# EasyEDA Pro project ProPrj_CH374_ESP32.epro

# Schematic CH374
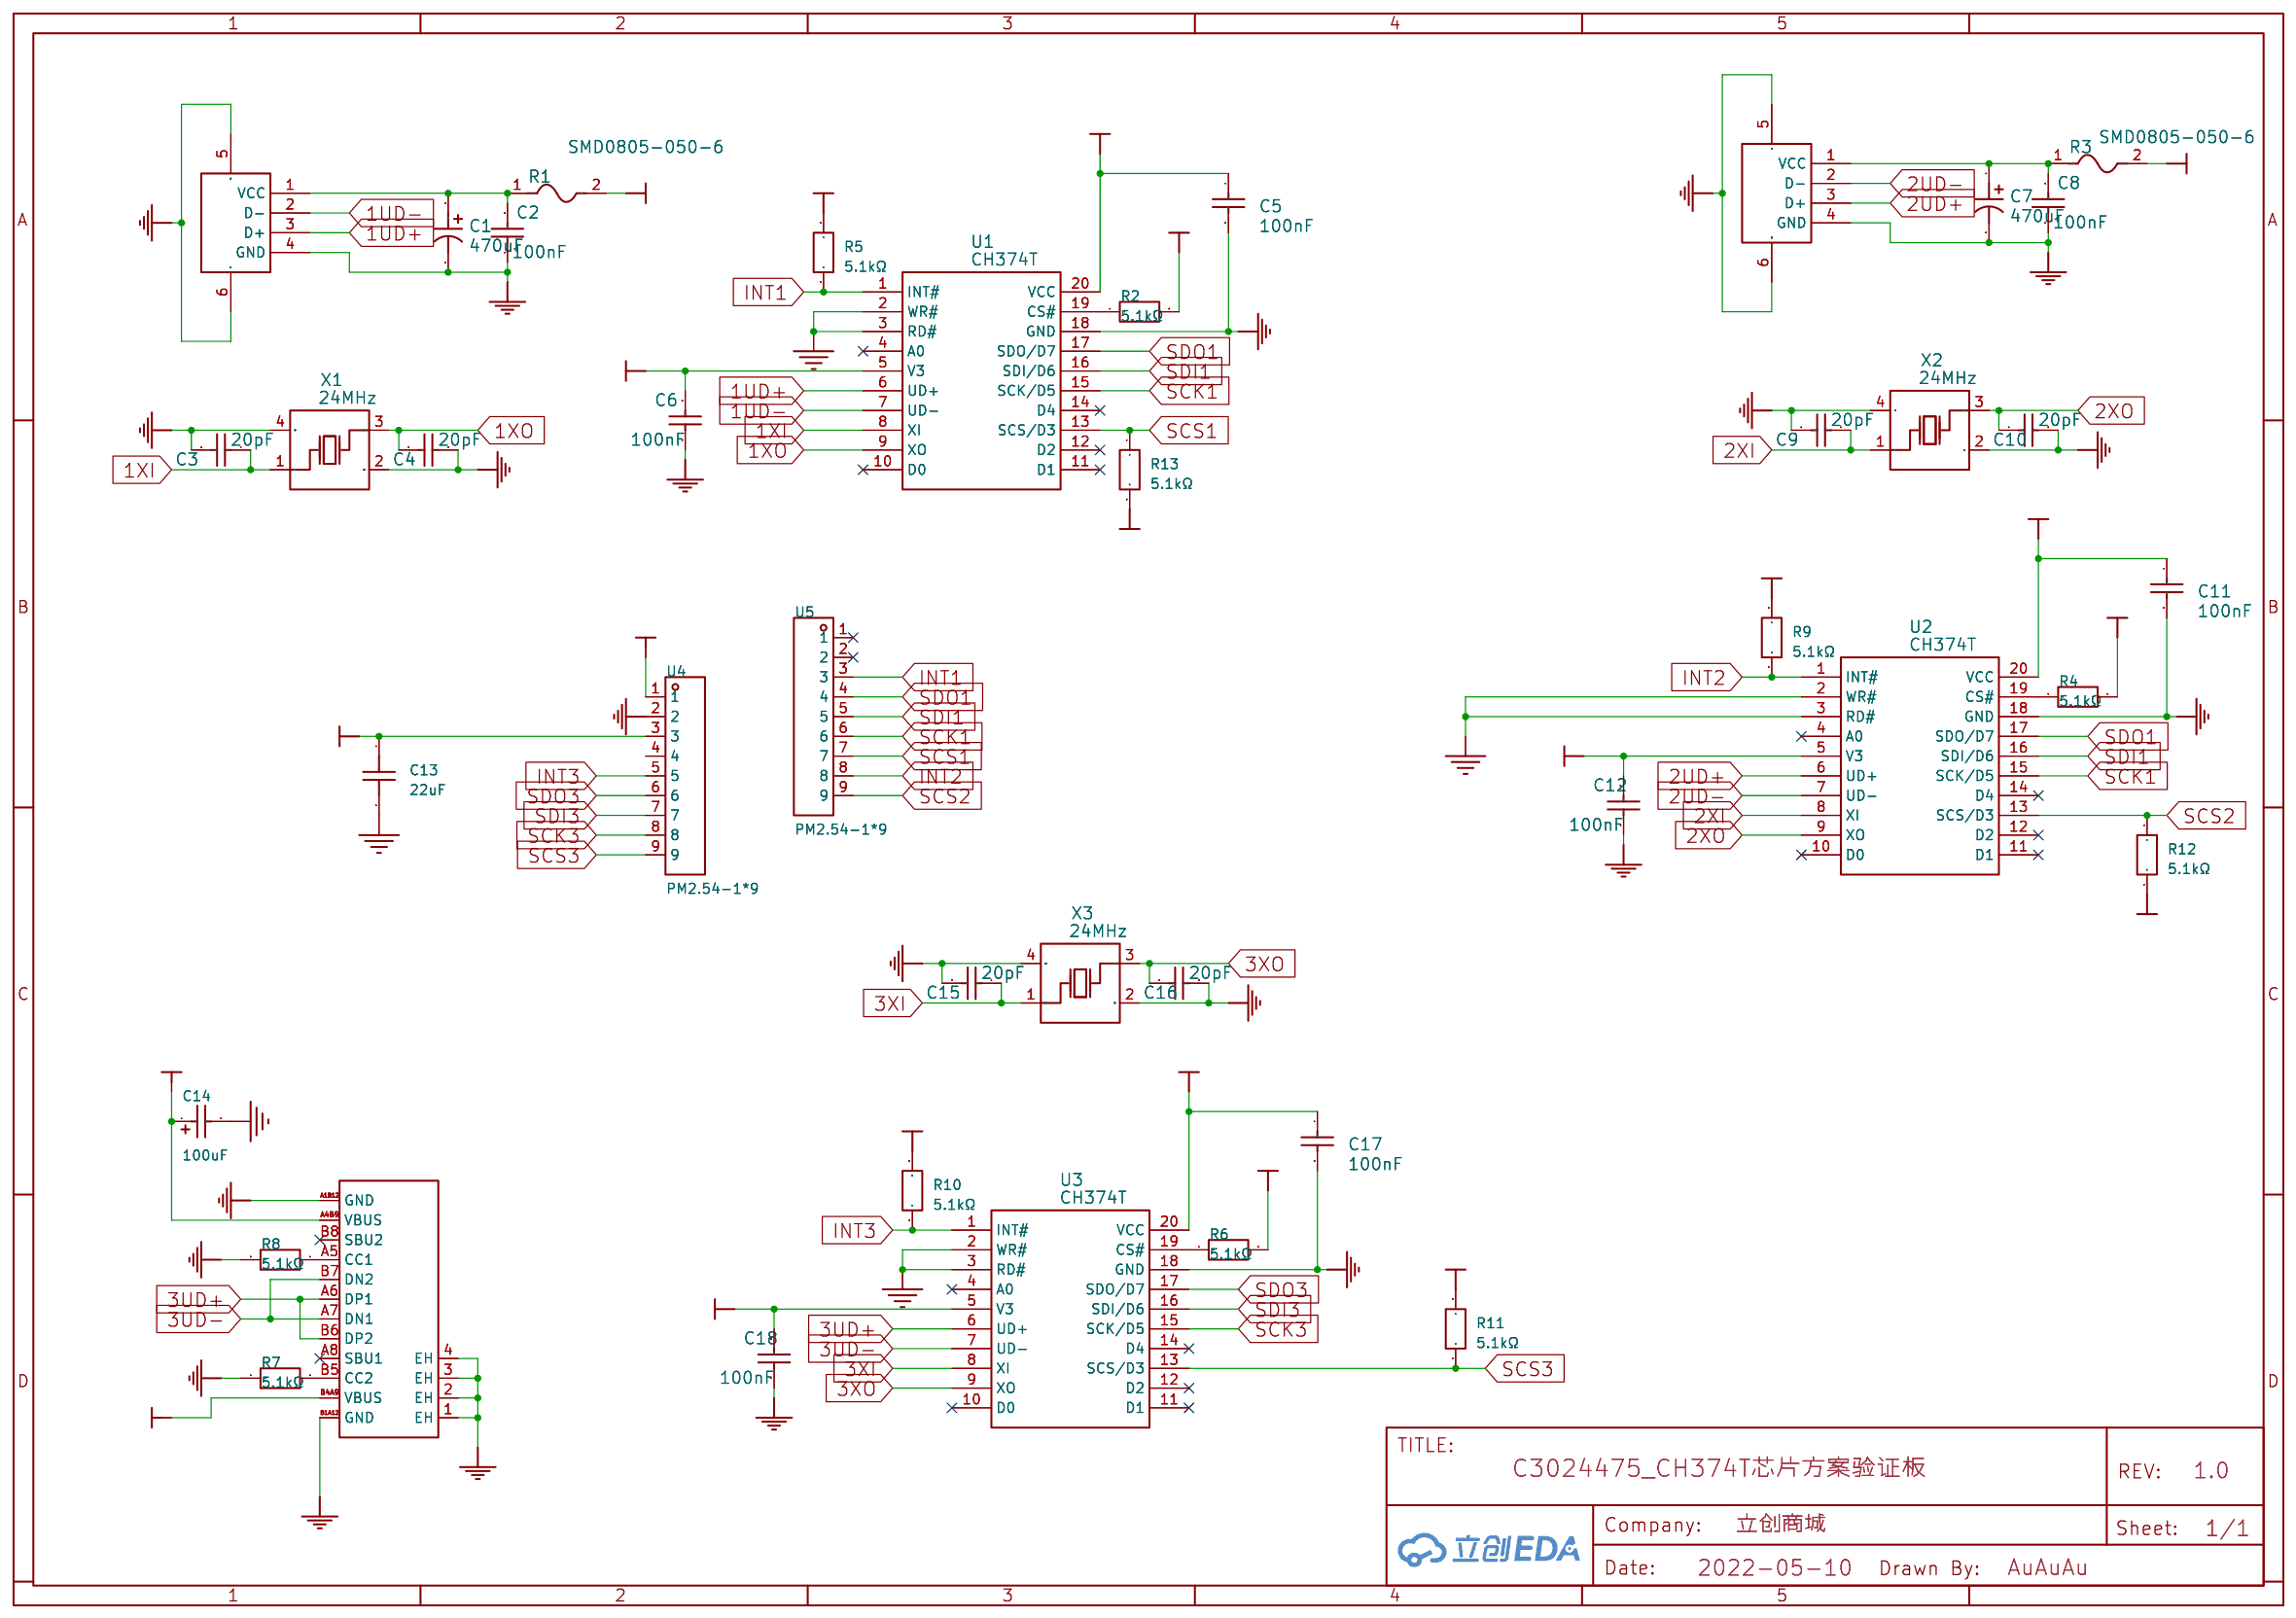
[diagram p0: schematic sheet]

## Parts
C1  470uF  [CAP-SMD_BD6.3-L6.6-W6.6-FD]
C2  100nF  [C0603]
C3  20pF  [C0603]
C4  20pF  [C0603]
C5  100nF  [C0603]
C6  100nF  [C0603]
C7  470uF  [CAP-SMD_BD6.3-L6.6-W6.6-FD]
C8  100nF  [C0603]
C9  20pF  [C0603]
C10  20pF  [C0603]
C11  100nF  [C0603]
C12  100nF  [C0603]
C13  22uF  [C0805]
C14  100uF  [CASE-B_3528]
C15  20pF  [C0603]
C16  20pF  [C0603]
C17  100nF  [C0603]
C18  100nF  [C0603]
R1  SMD0805-050-6  [F0805]
R2  5.1kΩ  [R0603]
R3  SMD0805-050-6  [F0805]
R4  5.1kΩ  [R0603]
R5  5.1kΩ  [R0603]
R6  5.1kΩ  [R0603]
R7  5.1kΩ  [R0603]
R8  5.1kΩ  [R0603]
R9  5.1kΩ  [R0603]
R10  5.1kΩ  [R0603]
R11  5.1kΩ  [R0603]
R12  5.1kΩ  [R0603]
R13  5.1kΩ  [R0603]
U1  CH374T  [SSOP-20_L7.5-W5.2-P0.65-LS8.0-BL]
U2  CH374T  [SSOP-20_L7.5-W5.2-P0.65-LS8.0-BL]
U3  CH374T  [SSOP-20_L7.5-W5.2-P0.65-LS8.0-BL]
U4  PM2.54-1*9  [HDR-TH_9P-P2.54-V-F-1]
U5  PM2.54-1*9  [HDR-TH_9P-P2.54-V-F-1]
USB1  U-USBAR04P-F002  [USB-A-TH_USB-302-T]
USB2  U-USBAR04P-F002  [USB-A-TH_USB-302-T]
USB3  TYPE-C-31-M-12  [USB-C_SMD-TYPE-C-31-M-12_1]
X1  24MHz  [CRYSTAL-SMD_4P-L3.2-W2.5-BL]
X2  24MHz  [CRYSTAL-SMD_4P-L3.2-W2.5-BL]
X3  24MHz  [CRYSTAL-SMD_4P-L3.2-W2.5-BL]

## Library data of the parts
C1 C7 = RVT1A471M0607_C335982: 容值:470uF;精度:±20%;额定电压:10V;纹波电流:200mA@120Hz;等效串联电阻(ESR):-;; LCSC Part Name: 470uF ±20% 10V; Supplier Part: C335982; Manufacturer: ROQANG(容强); Manufacturer Part: RVT1A471M0607; Supplier Footprint: SMD,D6.3xL7.7mm; JLCPCB Part Class: Extended Part; Supplier: LCSC; Tolerance: ±20%; Voltage Rating: 10V; Ripple Current: 200mA@120Hz; Diameter: 6.3mm; Height - Seated (Max): 7.7mm; Lifetime: 2000hrs@105℃; Operating Temperature: -40℃~+105℃; Type: 聚合物; PCB Layer: TopLayer
C2 C5 C6 = 0603B104K500NT: 容值:100nF;精度:±10%;额定电压:50V;温度系数:X7R;; LCSC Part Name: 100nF ±10% 50V; Supplier Part: C30926; Manufacturer: FH(风华); Supplier Footprint: 0603; JLCPCB Part Class: Extended Part; Datasheet: https://item.szlcsc.com/datasheet/0603B104K500NT/31683.html; Supplier: LCSC; Tolerance: ±10%; Voltage Rating: 50V; Temperature Coefficient: X7R; PCB Layer: TopLayer
C3 C4 = CC0603JRNPO9BN200: 容值:20pF;精度:±5%;额定电压:50V;材质(温度系数):NP0;; LCSC Part Name: 20pF ±5% 50V; Supplier Part: C105621; Manufacturer: YAGEO(国巨); Supplier Footprint: 0603; JLCPCB Part Class: Extended Part; Datasheet: https://atta.szlcsc.com/upload/public/pdf/source/20170505/1493957838062.pdf; Supplier: LCSC; Tolerance: ±5%; Voltage Rated: 50V; Temperature Coefficient: NP0; PCB Layer: TopLayer
C8 C11 C12 C17 C18 = 0603B104K500NT: 容值:100nF;精度:±10%;额定电压:50V;温度系数:X7R;; LCSC Part Name: 100nF ±10% 50V; Supplier Part: C30926; Manufacturer: FH(风华); Supplier Footprint: 0603; JLCPCB Part Class: Extended Part; Datasheet: https://item.szlcsc.com/datasheet/0603B104K500NT/31683.html; Supplier: LCSC; Tolerance: ±10%; Voltage Rating: 50V; Temperature Coefficient: X7R; Origin 3D Model Title: C0603_L1.6-W0.8-H0.8; PCB Layer: TopLayer
C9 C10 C15 C16 = CC0603JRNPO9BN200: 容值:20pF;精度:±5%;额定电压:50V;材质(温度系数):NP0;; LCSC Part Name: 20pF ±5% 50V; Supplier Part: C105621; Manufacturer: YAGEO(国巨); Supplier Footprint: 0603; JLCPCB Part Class: Extended Part; Datasheet: https://atta.szlcsc.com/upload/public/pdf/source/20170505/1493957838062.pdf; Supplier: LCSC; Tolerance: ±5%; Voltage Rated: 50V; Temperature Coefficient: NP0; Origin 3D Model Title: C0603_L1.6-W0.8-H0.8; PCB Layer: TopLayer
C13 = FCC0805X226M250FT: 容值:22uF;精度:±20%;额定电压:25V;温度系数:X5R;; LCSC Part Name: 22uF ±20% 25V; Supplier Part: C7419435; Manufacturer: FOJAN(富捷); Supplier Footprint: 0805; JLCPCB Part Class: Extended Part; Datasheet: https://item.szlcsc.com/datasheet/FCC0805X226M250FT/8393417.html; Supplier: LCSC; Tolerance: ±20%; Voltage Rating: 25V; Temperature Coefficient: X5R
C14 = TAJB107K006RNJ: 容值:100uF;精度:±10%;额定电压:6.3V;等效串联电阻(ESR):1.7Ω@100kHz;; LCSC Part Name: 100uF ±10% 6.3V; Supplier Part: C16133; Manufacturer: Kyocera AVX; Supplier Footprint: CASE-B-3528-21(mm); JLCPCB Part Class: Basic Part; Supplier: LCSC; Tolerance: ±10%; Voltage Rating: 6.3V; Equivalent Series Resistance(ESR): 1.7Ω@100kHz; Operating Temperature: -55℃~+125℃
R1 R3 = SMD0805-050-6: 耐压(Vmax):6V;最大电流(Imax):40A;保持电流(Ihold):500mA;跳闸电流(Itrip):1A;; LCSC Part Name: 6V 500mA; Supplier Part: C46640983; Manufacturer: R+O(宏嘉诚); Supplier Footprint: 0805; JLCPCB Part Class: Extended Part; Datasheet: https://item.szlcsc.com/datasheet/SMD0805-050-6/48798689.html; Supplier: LCSC; Voltage - Max: 6V; Current - Max: 40A; Hold Current: 500mA; Trip Current: 1A; Power Dissipation: 500mW; Resistance - Initial (Ri) (Min): 100mΩ; Resistance - Post Trip (R1) (Max): 850mΩ; Time to Trip(Max): 100ms; Operating Temperature: -40℃~+85℃; Length: 2.2mm; Width: 1.5mm; Height: 0.8mm
R2 R4-R13 = FRC0603F5101TS: 电阻类型:厚膜电阻;阻值:5.1kΩ;精度:±1%;功率:100mW;工作电压:75V;温度系数:±100ppm/℃;; LCSC Part Name: 5.1kΩ ±1% 100mW 厚膜电阻; Supplier Part: C2907044; Manufacturer: FOJAN(富捷); Supplier Footprint: 0603; JLCPCB Part Class: Extended Part; Supplier: LCSC; Type: 厚膜电阻; Tolerance: ±1%; Power(Watts): 100mW; Voltage-Supply(Max): 75V; Temperature Coefficient: ±100ppm/℃; Operating Temperature: -55℃~+155℃
U1 = CH374T: 应用功能:收发器;接口协议:USB 2.0;通道数:3;数据速率:12Mbps;; LCSC Part Name: USB总线接口芯片CH374; Supplier Part: C81627; Manufacturer: WCH(南京沁恒); Supplier Footprint: SSOP-20-208mil; JLCPCB Part Class: Extended Part; Datasheet: https://atta.szlcsc.com/upload/public/pdf/source/20240313/68BEEFB9FCA26BF3F560373D7752B1DD.pdf; Supplier: LCSC; Applications Function: 收发器; Protocol: USB 2.0; Number of Channels: 3; Supply Voltage: 5V；3.3V; Data Rate: 12Mbps; Operating Temperature: -40℃~+85℃; PCB Layer: TopLayer
U2 U3 = CH374T: 应用功能:收发器;接口协议:USB 2.0;通道数:3;数据速率:12Mbps;; LCSC Part Name: USB总线接口芯片CH374; Supplier Part: C81627; Manufacturer: WCH(南京沁恒); Supplier Footprint: SSOP-20-208mil; JLCPCB Part Class: Extended Part; Datasheet: https://atta.szlcsc.com/upload/public/pdf/source/20240313/68BEEFB9FCA26BF3F560373D7752B1DD.pdf; Supplier: LCSC; Applications Function: 收发器; Protocol: USB 2.0; Number of Channels: 3; Supply Voltage: 5V；3.3V; Data Rate: 12Mbps; Operating Temperature: -40℃~+85℃; Origin 3D Model Title: SSOP-20_L7.3-W5.3-H2.0-LS8.0-P0.65; PCB Layer: TopLayer
U4 U5 = PM2.54-1*9: 插孔结构:1x9P;间距:2.54mm;行距:2.54mm;圆孔/方孔:方孔;安装方式:直插;排数:单排;总孔位数:9P;额定电流:2.5A;插孔方向:顶部;塑高:8.5mm;工作温度:-40℃~+105℃;; LCSC Part Name: 间距:2.54mm 1x9P 直插; Supplier Part: C5224028; Manufacturer: ZHOURI(洲日); Supplier Footprint: 插件,P=2.54mm; JLCPCB Part Class: Extended Part; Datasheet: https://item.szlcsc.com/datasheet/PM2.54-1*9/5925207.html; Supplier: LCSC; Holes Structure: 1x9P; Pitch: 2.54mm; Row Spacing: 2.54mm; Circular Hole / Square Hole: 方孔; Mounting Type: 直插; Number of Rows: 单排; Number of Positions: 9P; Current Rating: 2.5A; Holes Direction: 顶部; Insulation Height: 8.5mm; Operating Temperature: -40℃~+105℃
USB1 USB2 = U-USBAR04P-F002: 连接器类型:Type-A;协议标准:USB 2.0;公母:母;安装方式:弯插;触点数量:4P;端口数量:1;额定电流 - 电源:1.5A;工作温度:0℃~+50℃;; LCSC Part Name: USB母座; Supplier Part: C386736; Manufacturer: Ckmtw(灿科盟); Supplier Footprint: 弯插; JLCPCB Part Class: Extended Part; Datasheet: https://item.szlcsc.com/datasheet/U-USBAR04P-F002/360843.html; Supplier: LCSC; Connector Type: Type-A; Protocol Standard: USB 2.0; Gender: 母; Mounting Type: 弯插; Number of Contacts: 4P; Number of Ports: 1; Current Rating-Power: 1.5A; Voltage Rating: 30V; Length: 14mm; Detection color: 白色; Operating Temperature: 0℃~+50℃; PCB Layer: TopLayer
USB3 = TYPE-C-31-M-12: 连接器类型:Type-C;协议标准:-;公母:母;安装方式:卧贴;触点数量:16P;端口数量:1;额定电流 - 电源:5A;工作温度:-30℃~+80℃;; LCSC Part Name: Type-C 母 卧贴; Supplier Part: C165948; Manufacturer: 韩国韩荣; Supplier Footprint: SMD; JLCPCB Part Class: Extended Part; Datasheet: https://item.szlcsc.com/datasheet/TYPE-C-31-M-12/177331.html; Supplier: LCSC; Connector Type: Type-C; Gender: 母; Mounting Type: 卧贴; Number of Contacts: 16P; Number of Ports: 1; Current Rating-Power: 5A; Voltage Rating: 20V; Connect-Disconnect Life: 1万次; Length: 7.35mm; Operating Temperature: -30℃~+80℃
X1 = X322524MSB4SI: 晶振类型:贴片晶振;频率:24MHz;常温频差:±10ppm;负载电容:20pF;频率稳定度:±20ppm;; LCSC Part Name: YSX321SL 24MHZ 4P 3225 20PF ±10PPM -40~85℃ (±20PPM); Supplier Part: C15643; Manufacturer: YXC(扬兴晶振); Supplier Footprint: SMD3225-4P; JLCPCB Part Class: Extended Part; Datasheet: https://item.szlcsc.com/datasheet/X322524MSB4SI/16324.html; Supplier: LCSC; Type: 贴片晶振; Normal temperature Frequency Tolerance: ±10ppm; Load Capacitance: 20pF; Frequency Stability: ±20ppm; Operating Temperature: -40℃~+85℃; PCB Layer: TopLayer
X2 X3 = X322524MSB4SI: 晶振类型:贴片晶振;频率:24MHz;常温频差:±10ppm;负载电容:20pF;频率稳定度:±20ppm;; LCSC Part Name: YSX321SL 24MHZ 4P 3225 20PF ±10PPM -40~85℃ (±20PPM); Supplier Part: C15643; Manufacturer: YXC(扬兴晶振); Supplier Footprint: SMD3225-4P; JLCPCB Part Class: Extended Part; Datasheet: https://item.szlcsc.com/datasheet/X322524MSB4SI/16324.html; Supplier: LCSC; Type: 贴片晶振; Normal temperature Frequency Tolerance: ±10ppm; Load Capacitance: 20pF; Frequency Stability: ±20ppm; Operating Temperature: -40℃~+85℃; Origin 3D Model Title: OSC-SMD_4P-L3.2-W2.5-H1.0; PCB Layer: TopLayer

## Nets
3V3: C5.1 C6.2 C11.1 C12.2 C13.1 C17.1 C18.2 R2.2 R4.2 R5.2 R6.2 R9.2 R10.2 R11.2 R12.2 R13.2 U1.5(V3) U1.20(VCC) U2.5(V3) U2.20(VCC) U3.5(V3) U3.20(VCC) U4.3
5V: C14.1 R1.2 R3.2 U4.1 USB3.A4B9(VBUS) USB3.B4A9(VBUS)
GND: C1.2 C2.1 C3.2 C4.2 C5.2 C6.1 C7.2 C8.1 C9.2 C10.2 C11.2 C12.1 C13.2 C14.2 C15.2 C16.2 C17.2 C18.1 R7.1 R8.2 U1.2(WR#) U1.3(RD#) U1.18(GND) U2.2(WR#) U2.3(RD#) U2.18(GND) U3.2(WR#) U3.3(RD#) U3.18(GND) U4.2 USB1.4(GND) USB1.5(SH1) USB1.6(SH2) USB2.4(GND) USB2.5(SH1) USB2.6(SH2) USB3.1(EH) USB3.2(EH) USB3.3(EH) USB3.4(EH) USB3.A1B12(GND) USB3.B1A12(GND) X1.2(GND) X1.4(GND) X2.2(GND) X2.4(GND) X3.2(GND) X3.4(GND)
1UD+: U1.6(UD+) USB1.3(D+)
1UD-: U1.7(UD-) USB1.2(D-)
1XI: C3.1 U1.8(XI) X1.1(OSC1)
1XO: C4.1 U1.9(XO) X1.3(OSC2)
2UD+: U2.6(UD+) USB2.3(D+)
2UD-: U2.7(UD-) USB2.2(D-)
2XI: C9.1 U2.8(XI) X2.1(OSC1)
2XO: C10.1 U2.9(XO) X2.3(OSC2)
3UD+: U3.6(UD+) USB3.A6(DP1) USB3.B6(DP2)
3UD-: U3.7(UD-) USB3.A7(DN1) USB3.B7(DN2)
3XI: C15.1 U3.8(XI) X3.1(OSC1)
3XO: C16.1 U3.9(XO) X3.3(OSC2)
INT1: R5.1 U1.1(INT#) U5.3
INT2: R9.1 U2.1(INT#) U5.8
INT3: R10.1 U3.1(INT#) U4.5
SCK1: U1.15(SCK/D5) U2.15(SCK/D5) U5.6
SCK3: U3.15(SCK/D5) U4.8
SCS1: R13.1 U1.13(SCS/D3) U5.7
SCS2: R12.1 U2.13(SCS/D3) U5.9
SCS3: R11.1 U3.13(SCS/D3) U4.9
SDI1: U1.16(SDI/D6) U2.16(SDI/D6) U5.5
SDI3: U3.16(SDI/D6) U4.7
SDO1: U1.17(SDO/D7) U2.17(SDO/D7) U5.4
SDO3: U3.17(SDO/D7) U4.6
$2N64: R2.1 U1.19(CS#)
$2N78: C1.1 C2.2 R1.1 USB1.1(VCC)
$2N79: R4.1 U2.19(CS#)
$2N90: C7.1 C8.2 R3.1 USB2.1(VCC)
$2N121: R6.1 U3.19(CS#)
$2N232: R8.1 USB3.A5(CC1)
$2N233: R7.2 USB3.B5(CC2)

Not connected (* = marked no-connect by the designer): U1 4(A0)* 10(D0)* 11(D1)* 12(D2)* 14(D4)*; U2 4(A0)* 10(D0)* 11(D1)* 12(D2)* 14(D4)*; U3 4(A0)* 10(D0)* 11(D1)* 12(D2)* 14(D4)*; U4 4; U5 1* 2*; USB3 A8(SBU1)* B8(SBU2)*

# Board PCB1
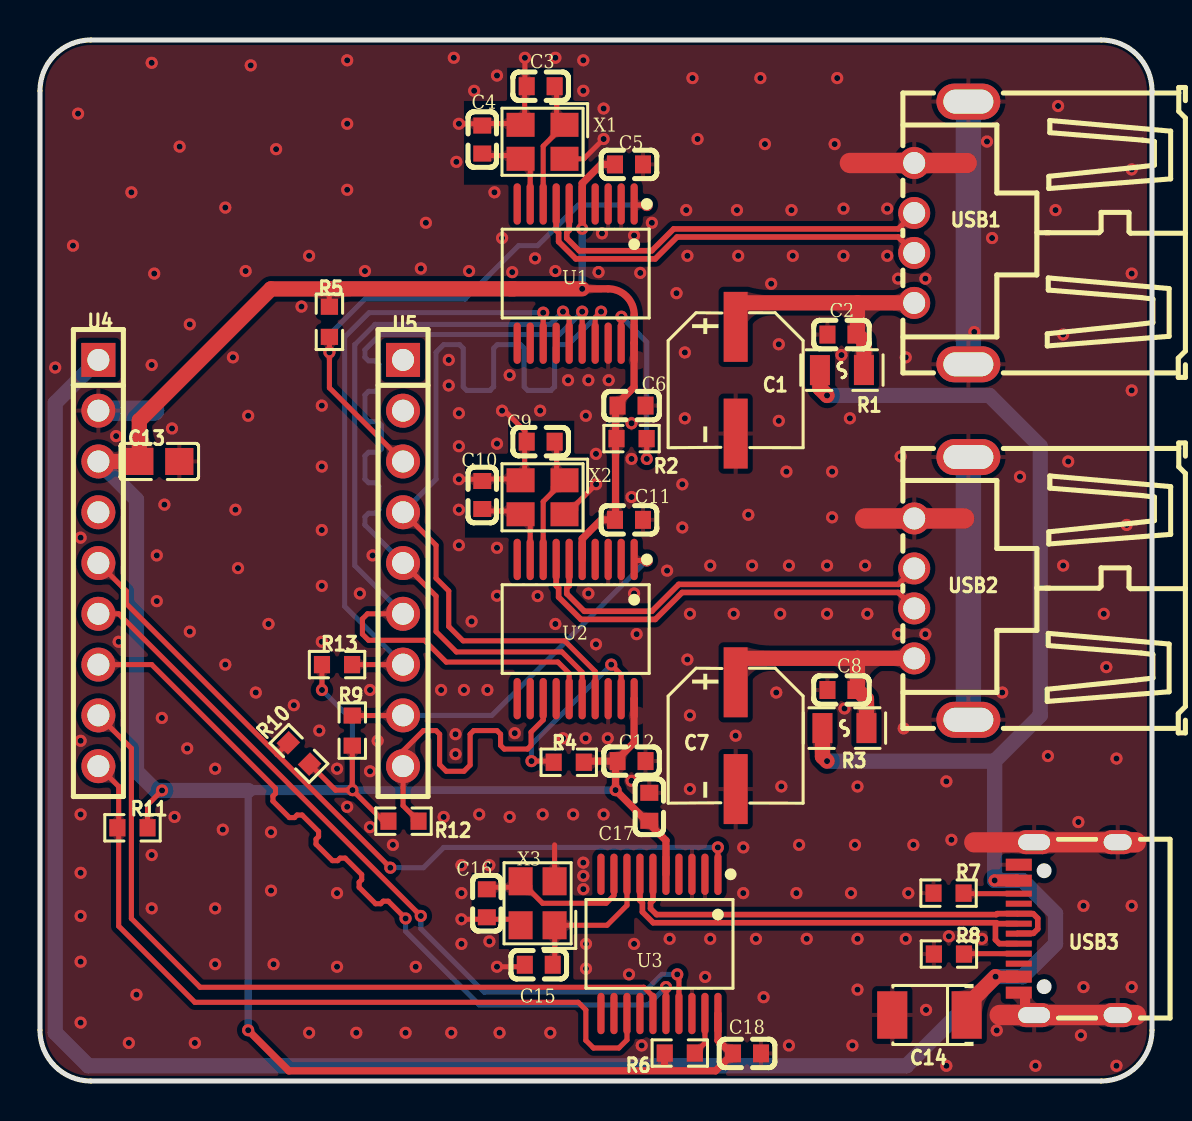
[diagram p1: board, top side]
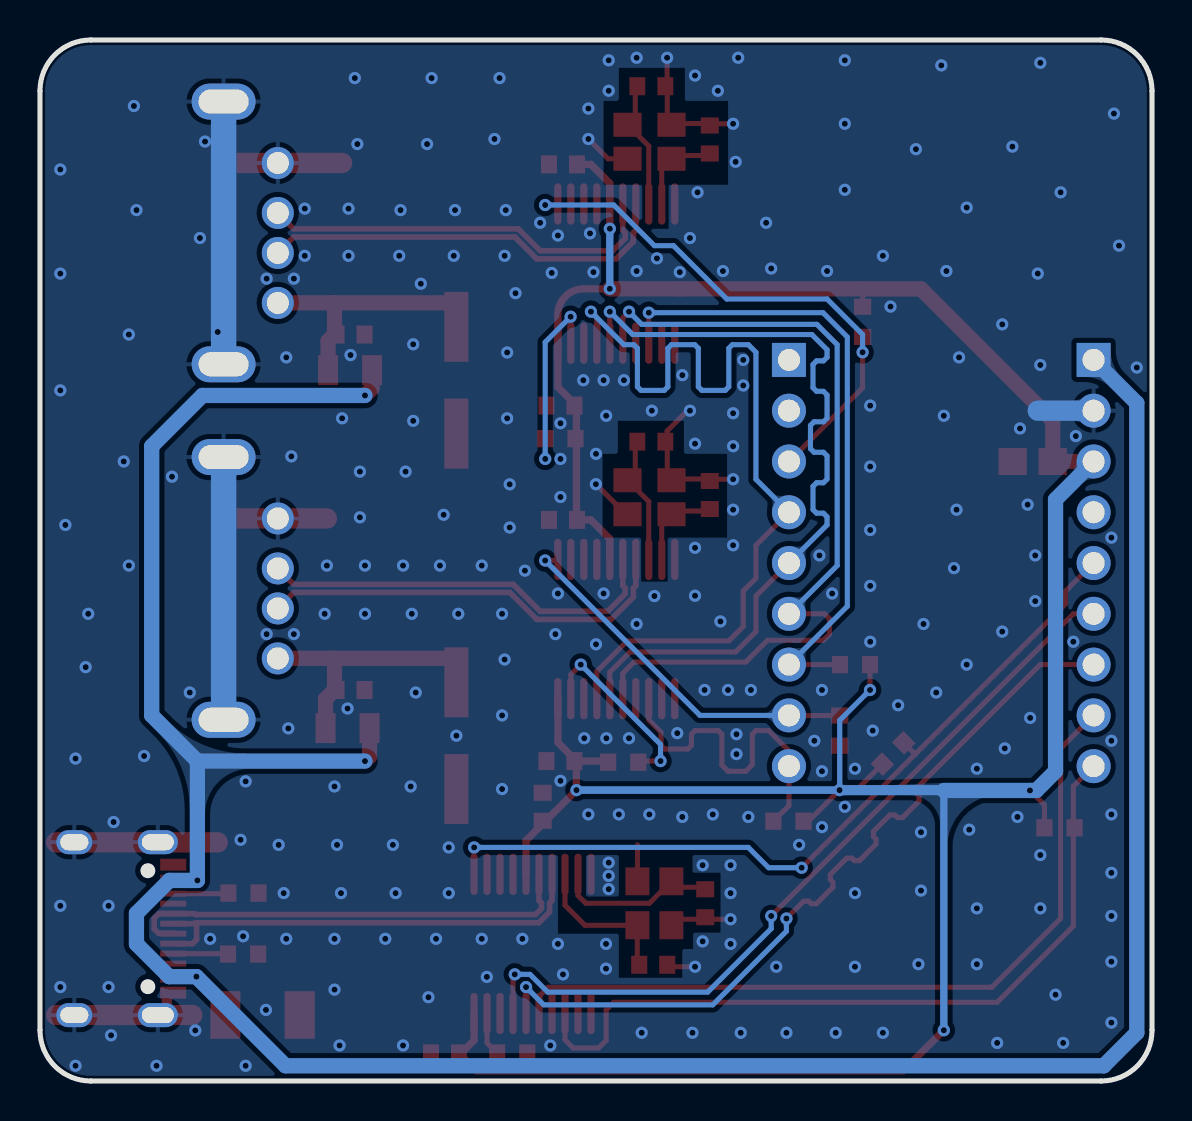
[diagram p2: board, bottom side, seen from below]

Outline 55.63 x 52.07 mm; copper layers: Top Layer, Bottom Layer. Coordinates in mm from the lower left corner of the outline.
Outline path: 0,49.53 0,2.54 arc(0.74,0.74) 2.54,0 53.09,0 arc(54.88,0.74) 55.63,2.54 55.63,49.53 arc(54.88,51.33) 53.09,52.07 2.54,52.07 arc(0.74,51.33) 0,49.53
Stack: Top Layer 0.035mm / Dielectric1 1.51mm FR4 er 4.5 / Bottom Layer 0.035mm

## Design rules (mm)
net 1UD+: usb1
net 1UD-: usb1
net 2UD+: usb2
net 2UD-: usb2
net 3UD+: usb3
net 3UD-: usb3
spacing copperThickness1oz (default): track to track 0.102, other pairs 0.152 to 0.3
spacing copperThickness2oz: track to track 0.203, other pairs 0.152 to 0.3
track width copperThickness1oz (default): min 0.127, default 0.254, max 2.54
track width copperThickness2oz: min 0.203, default 0.254, max 2.54
differential pair differentialPair (default): width min 0.127, default 0.279, max 2.54; gap min 0.127, default 0.127

## Placement (name value [footprint] x y rotation side)
C1  470uF  [CAP-SMD_BD6.3-L6.6-W6.6-FD]  34.8 35.05 270 top
C2  100nF  [C0603]  40.09 37.34 0 top
C3  20pF  [C0603]  25.04 49.76 180 top
C4  20pF  [C0603]  22.12 47.09 90 top
C5  100nF  [C0603]  29.46 45.85 0 top
C6  100nF  [C0603]  29.59 33.78 180 top
C7  470uF  [CAP-SMD_BD6.3-L6.6-W6.6-FD]  34.8 17.27 270 top
C8  100nF  [C0603]  40.09 19.56 0 top
C9  20pF  [C0603]  25.04 31.98 180 top
C10  20pF  [C0603]  22.12 29.31 90 top
C11  100nF  [C0603]  29.46 28.07 0 top
C12  100nF  [C0603]  29.59 16 180 top
C13  22uF  [C0805]  5.97 30.99 0 top
C14  100uF  [CASE-B_3528]  44.49 3.3 180 top
C15  20pF  [C0603]  24.95 5.82 180 top
C16  20pF  [C0603]  22.35 8.89 270 top
C17  100nF  [C0603]  30.48 13.72 90 top
C18  100nF  [C0603]  35.37 1.38 180 top
R1  SMD0805-050-6  [F0805]  40.11 35.56 180 top
R2  5.1kΩ  [R0603]  29.59 32.13 180 top
R3  SMD0805-050-6  [F0805]  40.24 17.65 180 top
R4  5.1kΩ  [R0603]  26.45 15.94 0 top
R5  5.1kΩ  [R0603]  14.48 37.97 90 top
R6  5.1kΩ  [R0603]  32 1.4 180 top
R7  5.1kΩ  [R0603]  45.45 9.4 0 top
R8  5.1kΩ  [R0603]  45.47 6.35 180 top
R9  5.1kΩ  [R0603]  15.62 17.53 270 top
R10  5.1kΩ  [R0603]  12.95 16.38 315 top
R11  5.1kΩ  [R0603]  4.63 12.67 0 top
R12  5.1kΩ  [R0603]  18.18 13 180 top
R13  5.1kΩ  [R0603]  14.86 20.83 180 top
U1  CH374T  [SSOP-20_L7.5-W5.2-P0.65-LS8.0-BL]  26.8 40.39 180 top
U2  CH374T  [SSOP-20_L7.5-W5.2-P0.65-LS8.0-BL]  26.8 22.61 180 top
U3  CH374T  [SSOP-20_L7.5-W5.2-P0.65-LS8.0-BL]  30.99 6.86 180 top
U4  PM2.54-1*9  [HDR-TH_9P-P2.54-V-F-1]  2.92 25.91 270 top
U5  PM2.54-1*9  [HDR-TH_9P-P2.54-V-F-1]  18.16 25.91 270 top
USB1  U-USBAR04P-F002  [USB-A-TH_USB-302-T]  45.09 42.42 90 top
USB2  U-USBAR04P-F002  [USB-A-TH_USB-302-T]  45.09 24.64 90 top
USB3  TYPE-C-31-M-12  [USB-C_SMD-TYPE-C-31-M-12_1]  51.44 7.62 90 top
X1  24MHz  [CRYSTAL-SMD_4P-L3.2-W2.5-BL]  25.14 46.98 180 top
X2  24MHz  [CRYSTAL-SMD_4P-L3.2-W2.5-BL]  25.14 29.2 180 top
X3  24MHz  [CRYSTAL-SMD_4P-L3.2-W2.5-BL]  24.89 8.89 90 top

## Footprints (pads in the part's own frame, mm; a bottom-side part is the same pattern mirrored in y, then rotated)
C0603
  rect 0.8x0.9 smd: 1(-0.7,0) 2(0.7,0)
C0805
  rect 1.41x1.35 smd: 1(-1,0) 2(1,0)
CAP-SMD_BD6.3-L6.6-W6.6-FD
  rect 3.5x1.2 smd: 1(-2.67,0) 2(2.67,0)
CASE-B_3528
  rect 1.506x2.376 smd: 1(-1.861,0) 2(1.861,0)
CRYSTAL-SMD_4P-L3.2-W2.5-BL
  rect 1.4x1.2 smd: 1(-1.1,-0.85) 2(1.1,-0.85) 3(1.1,0.85) 4(-1.1,0.85)
F0805
  rect 1x1.5 smd: 1(-1.1,0) 2(1.1,0)
HDR-TH_9P-P2.54-V-F-1
  rect 1.7x1.7 hole 1.1: 1(-10.16,0)
  round 1.7 hole 1.1: 2(-7.62,0) 3(-5.08,0) 4(-2.54,0) 5(0,0) 6(2.54,0) 7(5.08,0) 8(7.62,0) 9(10.16,0)
R0603
  rect 0.806x0.864 smd: 1(-0.753,0) 2(0.753,0)
SSOP-20_L7.5-W5.2-P0.65-LS8.0-BL
  oval 0.364x2.069 smd: 1(-2.925,-3.482) 2(-2.275,-3.482) 3(-1.625,-3.482) 4(-0.975,-3.482) 5(-0.325,-3.482) 6(0.325,-3.482) 7(0.975,-3.482) 8(1.625,-3.482) 9(2.275,-3.482) 10(2.925,-3.482) 11(2.925,3.482) 12(2.275,3.482) 13(1.625,3.482) 14(0.975,3.482) 15(0.325,3.482) 16(-0.325,3.482) 17(-0.975,3.482) 18(-1.625,3.482) 19(-2.275,3.482) 20(-2.925,3.482)
USB-A-TH_USB-302-T
  round 1.6 hole 1.1: 1(-3.5,1.355) 2(-1,1.355) 3(1,1.355) 4(3.5,1.355)
  oval 1.8x3.2 hole 1.2x2.5: 5(-6.57,-1.355) 6(6.57,-1.355)
USB-C_SMD-TYPE-C-31-M-12_1
  oval 1.2x2 hole 0.8x1.6: 1(4.325,1.706) 4(-4.325,1.706)
  oval 1.2x1.8 hole 0.8x1.4: 2(4.325,-2.474) 3(-4.325,-2.474)
  custom 0.6x1.3 smd: A1B12(-3.2,2.474) A4B9(-2.4,2.474) B1A12(3.2,2.474) B4A9(2.401,2.474)
  rect 0.3x1.3 smd: A5(-1.25,2.474) A6(-0.25,2.474) A7(0.25,2.474) A8(1.25,2.474) B5(1.75,2.474) B6(0.75,2.474) B7(-0.75,2.474) B8(-1.75,2.474)

## Nets
As in the schematic.

Pads without a net: U1 4 10 11 12 14; U2 4 10 11 12 14; U3 4 10 11 12 14; U4 4; U5 1 2; USB3 A8 B8

## Via types
v1: diameter 0.61, hole 0.305, Top Layer to Bottom Layer, 300 vias

## Routing (per net, layer and track width the routed paths; a pad name or vN(x,y) marks a point on that pad's centre or on a via; arc(x,y) is an arc through that point)
3V3: length 163
  Top Layer w0.254: R9.2 15.62,14.56 v1(15.63,14.55) ; v1(15.63,14.55) 14.79,14.55 R10.2 ; v1(15.63,14.55) 17.18,13 R12.2 ; v1(6.11,14.53) 5.38,13.81 5.38,12.67 ; R13.2 v1(14.11,19.56) ; 14.47,38.97 14.47,39.61 14.46,39.62
  Top Layer w0.363: 34.57,1.38 33.91,2.03 U3.20 ; 28.54,45.85 28.07,45.85 27.12,44.9 U1.5 v1(27.12,42.63) ; C18.2 33.8,0.51 12.45,0.51 v1(10.41,2.54) ; R6.2 31.24,1.39 31.24,0.63 ; U2.20 29.72,19.12 29.72,16.93 28.79,16 ; v1(27.12,39.62) 28.42,39.62 arc(29.34,39.24) 29.72,38.32 U1.20 29.72,36.9 29.72,34.71 28.79,33.78 28.79,28.19 28.66,28.07 ; 28.79,16 v1(28.79,14.55) 31.31,12.03 U3.5 ; 28.79,16 27.26,16 R4.2 ; 28.54,28.07 28.07,28.07 27.12,27.12 U2.5
  Top Layer w0.762: U4.3 C13.1 4.97,33.04 11.55,39.62 14.46,39.62 ; v1(27.12,39.62) 23.7,39.62 arc(23.62,39.62) 23.54,39.62 14.48,39.62 arc(14.47,39.62) 14.47,39.61
  Bottom Layer w0.254: v1(14.11,19.56) 15.62,18.04 15.62,14.56 v1(15.63,14.55)
  Bottom Layer w0.363: 10.41,14.53 v1(10.41,2.54) ; v1(27.12,42.63) v1(27.12,39.62)
  Bottom Layer w0.381: v1(28.79,14.55) v1(15.63,14.55)
  Bottom Layer w0.508: 10.41,14.53 10.43,14.55 v1(15.63,14.55)
  Bottom Layer w0.762: U4.3 4.83,29.08 4.83,15.49 5.79,14.53 10.41,14.53
5V: length 143.7
  Top Layer w0.6: v1(47.75,10.03) 48.88,10.03 48.89,10.02 ; 48.89,5.22 v1(47.8,5.22)
  Top Layer w0.762: v1(39.37,34.29) 39.01,34.65 R1.2 ; C14.1 46.35,3.77 v1(47.8,5.22) ; R3.2 39.14,16.23 v1(39.37,16)
  Bottom Layer w0.762: v1(39.37,34.29) 47.5,34.29 50.04,31.75 50.04,18.29 47.75,16 ; 47.75,16 v1(47.75,10.03) 49.15,10.03 50.8,8.38 50.8,6.86 49.16,5.22 v1(47.8,5.22) 43.34,0.76 2.41,0.76 0.76,2.41 0.76,33.91 U4.1 ; 47.75,16 v1(39.37,16)
GND: length 80.4
  Top Layer w0.254: v1(23.11,33.53) 23.24,33.53 24.26,32.51 24.26,31.99 24.24,31.98 24.24,30.25 X2.2 23.97,30.11 22.12,30.11 22.11,30.1 v1(20.96,30.1) ; X3.2 25.74,11.81 ; 24.15,5.82 24.05,5.71 v1(22.86,5.71) ; v1(28.19,47.12) 27.2,46.13 X1.4 ; X2.4 26.32,28.35 v1(27.82,29.85) ; v1(21.08,8.09) 24.04,8.09 ; v1(24.26,51.18) 24.26,49.77 24.24,49.76 24.24,48.03 X1.2 23.97,47.89 22.12,47.89 22.11,47.88 v1(20.96,47.88)
  Top Layer w0.508: 49.28,3.3 49.28,4.42
  Top Layer w1.016: 48.01,3.3 54.82,3.3 ; 41.28,28.14 USB2.4 46.23,28.14 ; 40.51,45.92 USB1.4 46.35,45.92 ; 54.82,11.94 46.74,11.94
  Bottom Layer w1.016: U4.2 5.72,33.53
  Bottom Layer w1.27: USB2.5 46.44,31.21 ; 46.44,48.99 USB1.5
  vias: v1(0.76,35.69) v1(1.65,41.78) v1(1.91,48.39) v1(2.03,27.18) v1(2.03,17.02) v1(2.03,13.33) v1(2.03,10.41) v1(2.03,8.25) v1(2.03,5.97) v1(2.03,2.92) v1(3.81,32.26) v1(3.94,21.97) v1(4.45,1.9) v1(4.57,44.45) v1(4.83,4.32) v1(5.59,50.93) v1(5.59,35.81) v1(5.59,11.3) v1(5.59,8.64) v1(5.72,40.39) v1(5.84,26.29) v1(5.84,24) v1(6.1,18.16) v1(6.22,28.83) v1(6.6,32.64) v1(6.73,13.21) v1(6.98,46.74) v1(7.37,16.64) v1(7.49,37.85) v1(7.49,22.48) v1(7.75,1.9) v1(8.76,15.62) v1(8.76,8.64) v1(8.76,5.84) v1(9.14,12.57) v1(9.27,43.69) v1(9.27,20.83) v1(9.65,36.19) v1(9.78,28.57) v1(9.91,25.65) v1(10.29,40.51) v1(10.41,33.27) v1(10.54,50.8) v1(10.8,19.43) v1(11.43,22.86) v1(11.56,12.45) v1(11.56,9.52) v1(11.68,5.84) v1(11.81,46.61) v1(12.7,18.8) v1(13.08,38.73) v1(13.46,41.27) v1(13.46,2.41) v1(13.97,17.53) v1(14.1,33.78) v1(14.1,30.73) v1(14.1,27.56) v1(14.1,24.76) v1(14.1,21.97) v1(14.86,15.62) v1(14.86,9.4) v1(14.86,5.71) v1(15.37,51.05) v1(15.37,47.88) v1(15.37,44.58) v1(15.37,13.72) v1(15.82,2.41) v1(16,24.38) v1(16.26,40.51) v1(16.51,19.56) v1(16.51,15.49) v1(16.51,12.7) v1(16.64,26.29) v1(16.89,17.02) v1(17.65,11.81) v1(18.29,2.41) v1(18.8,5.71) v1(19.05,40.64) v1(19.3,42.93) v1(20.07,19.56) v1(20.19,13.21) v1(20.45,36.07) v1(20.45,34.79) v1(20.57,2.41) v1(20.7,51.18) v1(20.83,45.97) v1(20.79,17.35) v1(20.79,16.35) v1(20.96,33.4) v1(20.96,31.75) v1(20.96,28.57) v1(20.96,26.8) v1(21.08,10.79) v1(21.08,9.4) v1(21.08,6.86) v1(21.21,19.56) v1(21.46,40.51) v1(21.59,22.99) v1(21.72,49.53) v1(21.97,13.33) v1(22.38,19.56) v1(22.48,10.79) v1(22.48,6.98) v1(22.73,44.45) v1(22.86,50.29) v1(22.86,31.88) v1(22.86,26.67) v1(22.86,24.27) v1(22.99,2.41) v1(23.11,42.16) v1(23.5,35.31) v1(23.5,13.21) v1(23.62,40.46) v1(23.75,17.4) v1(24.77,41.15) v1(24.89,24.26) v1(25.02,33.53) v1(25.15,13.33) v1(25.53,2.41) v1(25.78,51.18) v1(25.78,40.51) v1(25.78,22.86) v1(26.16,17.14) v1(26.42,35.05) v1(26.67,13.33) v1(27.18,51.05) v1(27.18,49.53) v1(27.18,10.92) v1(27.18,10.26) v1(27.18,9.6) v1(27.31,33.27) v1(27.29,17.14) v1(27.31,6.86) v1(27.31,5.62) v1(27.43,35.05) v1(27.43,24.38) v1(27.81,31.37) v1(27.81,21.84) v1(27.94,40.46) v1(28.11,42.4) v1(28.19,48.64) v1(28.19,13.33) v1(28.45,35.05) v1(28.4,17.14) v1(29.46,5.33) v1(29.59,32.9) v1(29.59,31.11) v1(29.59,29.21) v1(29.59,15.02) v1(29.72,42.29) v1(29.72,24.38) v1(29.72,6.86) v1(29.84,22.35) v1(30.03,40.42) v1(30.1,1.78) v1(30.61,42.93) v1(31.37,25.53) v1(31.5,7.11) v1(31.84,39.4) v1(32.13,29.84) v1(32.13,27.69) v1(32.26,36.44) v1(32.26,33.15) v1(32.33,43.56) v1(32.38,41.27) v1(32.38,21.08) v1(32.51,23.37) v1(32.51,18.29) v1(32.51,14.6) v1(32.64,50.16) v1(32.89,47.12) v1(33.27,5.21) v1(33.53,25.78) v1(33.53,7.11) v1(34.7,23.37) v1(34.8,17.27) v1(34.86,43.56) v1(34.93,41.27) v1(35.18,11.68) v1(35.18,9.4) v1(35.43,28.32) v1(35.62,25.78) v1(35.81,7.11) v1(36.04,50.16) v1(36.19,4.19) v1(36.26,46.86) v1(36.58,39.88) v1(36.83,19.43) v1(36.96,36.85) v1(36.96,33.02) v1(37.03,23.37) v1(37.08,14.73) v1(37.34,30.48) v1(37.47,25.78) v1(37.47,1.78) v1(37.59,43.56) v1(37.66,41.27) v1(37.84,9.4) v1(37.97,11.81) v1(38.35,7.11) v1(39.37,25.78) v1(39.37,23.37) v1(39.62,30.48) v1(39.62,28.19) v1(39.75,46.86) v1(39.88,50.16) v1(40.09,36.31) v1(40.19,43.63) v1(40.19,41.27) v1(40.24,18.63) v1(40.51,33.15) v1(40.57,9.4) v1(40.64,1.78) v1(40.77,11.81) v1(40.89,14.73) v1(40.89,7.11) v1(40.89,4.57) v1(41.28,25.78) v1(41.38,23.37) v1(42.38,43.63) v1(42.38,41.27) v1(42.93,40.13) v1(42.93,22.35) v1(43.05,31.24) v1(43.2,17.64) v1(43.31,36.19) v1(43.31,7.11) v1(43.43,9.4) v1(43.69,11.81) v1(44.29,40.13) v1(44.29,22.35) v1(44.32,3.56) v1(45.34,14.99) v1(45.34,0.76) v1(45.47,7.24) v1(45.59,12.06) v1(46.74,37.46) v1(47.12,7.11) v1(47.37,46.99) v1(47.62,42.16) v1(47.86,2.53) v1(48.13,19.43) v1(49.02,30.23) v1(49.8,0.76) v1(50.42,16.26) v1(50.8,43.56) v1(50.93,48.77) v1(51.18,37.34) v1(51.18,25.78) v1(51.44,30.99) v1(51.94,12.95) v1(52.07,2.29) v1(52.2,8.76) v1(52.2,4.7) v1(53.21,23.37) v1(53.34,20.7) v1(53.85,16.13) v1(53.85,0.76) v1(54.36,27.81) v1(54.61,45.59) v1(54.61,40.39) v1(54.61,34.54) v1(54.61,8.76) v1(54.61,4.7)
1UD+: length 20.2
  Top Layer w0.28: 43.74,43.42 42.94,42.62 31.7,42.62 30.61,41.53 26.97,41.53 26.35,42.15 26.35,42.43 26.47,42.55 U1.6
1UD-: length 20.9
  Top Layer w0.28: 43.74,41.42 42.94,42.21 31.87,42.21 30.78,41.12 26.81,41.12 25.94,41.98 25.94,42.43 25.82,42.55 U1.7
1XI: length 6.5
  Top Layer w0.254: U1.8 25.17,46.76 X1.1 25.84,48.22 25.84,49.76
1XO: length 4.4
  Top Layer w0.254: 22.12,46.29 23.87,46.29 X1.3 24.52,45.64 U1.9
2UD+: length 20.4
  Top Layer w0.28: U2.6 26.47,24.77 26.35,24.65 26.35,24.37 27.23,23.49 30.61,23.49 31.95,24.84 42.94,24.84 43.74,25.64
2UD-: length 21.1
  Top Layer w0.28: 43.74,23.64 42.94,24.43 32.12,24.43 30.78,23.09 27.06,23.09 25.94,24.2 25.94,24.65 25.82,24.77 U2.7
2XI: length 6.5
  Top Layer w0.254: U2.8 25.17,28.98 X2.1 25.84,30.44 25.84,31.98
2XO: length 4.4
  Top Layer w0.254: 22.12,28.51 23.87,28.51 X2.3 24.52,27.86 U2.9
3UD+: length 23
  Top Layer w0.28: 48.89,7.37 48.9,7.39 49.69,7.39 49.91,7.6 49.91,8.13 49.68,8.37 47.88,8.37 47.84,8.32 30.84,8.32 30.54,8.62 30.54,8.9 30.66,9.03 U3.6
3UD-: length 23
  Top Layer w0.28: 47.88,7.87 47.84,7.92 30.67,7.92 30.13,8.46 30.13,8.9 30.01,9.03 U3.7 ; 47.88,7.87 48.89,7.87 ; 47.88,7.87 47.81,7.87 47.79,7.86 47.79,7.07 47.99,6.87 48.89,6.87
3XI: length 7.6
  Top Layer w0.254: U3.8 29.36,8.79 28.36,7.79 X3.1 25.75,7.78 25.75,5.82
3XO: length 8.2
  Top Layer w0.254: 22.35,9.69 23.74,9.69 X3.3 25.14,8.89 28.32,8.89 28.71,9.28 U3.9
INT1: length 28.1
  Top Layer w0.254: 14.47,37.46 14.48,37.46 v1(14.48,36.45) 14.48,34.67 U5.3 ; U1.1 29.78,43.81 v1(30.36,43.81)
  Bottom Layer w0.254: v1(30.36,43.81) 26.92,43.81 24.89,41.78 23.94,41.78 21.27,39.12 16.26,39.12 14.48,37.34 v1(14.48,36.45)
INT2: length 18.6
  Top Layer w0.254: U2.1 29.78,26.03 v1(30.36,26.03) ; R9.1 18.15,18.28 U5.8
  Bottom Layer w0.254: U5.8 22.61,18.29 v1(30.36,26.03)
INT3: length 40.3
  Top Layer w0.254: U4.5 4.32,24.51 4.32,23.88 11.86,16.34 ; 11.86,16.34 11.86,16.35 R10.1 ; 11.86,16.34 v1(17.53,10.67) ; U3.1 33.91,11.68 v1(33.91,11.68)
  Bottom Layer w0.254: v1(17.53,10.67) 19.18,10.67 20.19,11.68 v1(33.91,11.68)
SCK1: length 42.6
  Top Layer w0.254: v1(26.16,38.48) 26.47,38.17 U1.15 ; U2.15 26.47,20.39 25.91,20.95 20.32,20.95 19.23,22.05 16.44,22.05 16.13,22.35 16.13,23.11 16.38,23.37 U5.6
  Bottom Layer w0.254: v1(26.16,38.48) 25.53,37.85 16.76,37.85 15.75,36.83 15.75,25.78 U5.6
SCK3: length 39.4
  Top Layer w0.254: U3.15 30.66,4.23 30.2,4.69 8.01,4.69 4.57,8.13 4.57,16.64 U4.8
SCS1: length 32.1
  Top Layer w0.254: U5.7 R13.1 ; U1.13 v1(25.17,38.43)
  Bottom Layer w0.254: v1(25.17,38.43) 16.46,38.43 15.24,37.21 15.24,23.75 U5.7
SCS2: length 17.5
  Top Layer w0.254: R12.1 18.16,13.77 U5.9 18.16,16.51 19.18,17.53 19.81,17.53 19.99,17.35 19.99,15.82 20.32,15.49 21.21,15.49 21.52,15.8 21.52,17.35 21.69,17.53 22.86,17.53 23.04,17.35 23.04,16.78 23.22,16.6 24.38,16.6 24.56,16.78 24.56,17.45 25.17,18.06 U2.13
SCS3: length 38.8
  Top Layer w0.254: U4.9 3.94,14.73 3.94,7.75 7.75,3.94 26.92,3.94 27.31,3.56 27.31,2.03 27.69,1.65 28.96,1.65 29.36,2.06 U3.13
SDI1: length 41.5
  Top Layer w0.254: U2.16 27.12,20.45 26.11,21.46 20.83,21.46 19.81,22.48 19.81,24.26 U5.5 ; U1.16 v1(27.12,38.48)
  Bottom Layer w0.254: U5.5 16.26,27.81 16.26,28.22 16.44,28.4 16.78,28.4 16.96,28.58 16.96,29.74 16.78,29.92 16.44,29.92 16.26,30.1 16.26,31.27 16.44,31.45 16.91,31.45 17.08,31.63 17.08,32.79 16.91,32.97 16.44,32.97 16.26,33.15 16.26,34.32 16.44,34.5 16.78,34.5 16.96,34.68 16.96,35.84 16.78,36.02 16.44,36.02 16.26,36.2 16.26,36.58 17.02,37.34 25.98,37.34 v1(27.12,38.48)
SDI3: length 39.5
  Top Layer w0.254: v1(18.29,8.13) 17.42,8.99 17.17,8.99 17.04,8.87 16.79,8.87 15.96,9.69 15.96,9.94 16.09,10.07 16.09,10.32 15.27,11.15 15.01,11.15 14.89,11.02 14.63,11.02 13.81,11.84 13.81,12.1 13.94,12.23 13.94,12.48 13.11,13.3 12.86,13.3 12.73,13.18 12.48,13.18 11.65,14 11.65,14.25 11.78,14.38 11.78,14.64 5.59,20.83 U4.7 ; U3.16 v1(31.31,4.7)
  Bottom Layer w0.254: v1(18.29,8.13) 18.29,7.49 21.97,3.81 30.42,3.81 v1(31.31,4.7)
SDO1: length 44.1
  Top Layer w0.254: U5.4 19.81,26.8 19.81,25.15 20.45,24.51 20.45,22.73 21.16,22.02 26.24,22.02 27.77,20.49 U2.17 ; U1.17 27.77,38.19 v1(28.07,38.48)
  Bottom Layer w0.254: U5.4 19.81,30.1 19.81,36.45 20.19,36.83 20.99,36.83 21.17,36.65 21.17,34.72 21.35,34.54 22.51,34.54 22.69,34.72 22.69,36.65 22.87,36.83 24.04,36.83 24.22,36.65 24.22,34.72 24.4,34.54 25.56,34.54 25.74,34.72 25.74,36.65 25.92,36.83 26.42,36.83 v1(28.07,38.48)
SDO3: length 39.5
  Top Layer w0.254: U3.17 31.96,5.25 v1(31.88,5.33) ; U4.6 3.94,23.37 v1(19.05,8.25)
  Bottom Layer w0.254: v1(31.88,5.33) 31.12,5.33 30.23,4.44 22.22,4.44 19.05,7.62 v1(19.05,8.25)
$2N64: length 10
  Top Layer w0.254: U1.19 29.07,38.22 v1(29.08,38.23) ; v1(30.35,31.11) 30.35,32.12 R2.1
  Bottom Layer w0.254: v1(29.08,38.23) 30.35,36.96 v1(30.35,31.11)
$2N78: length 12.4
  Top Layer w0.762: R1.1 41.21,37.01 40.89,37.34 40.89,38.92 ; 40.89,38.92 34.8,38.92 ; 40.89,38.92 43.74,38.92
$2N79: length 9.5
  Top Layer w0.254: U2.19 29.07,20.33 v1(28.57,20.83) ; R4.1 25.64,16 v1(24.59,16)
  Bottom Layer w0.254: v1(24.59,16) 24.59,16.84 v1(28.57,20.83)
$2N90: length 12.6
  Top Layer w0.762: 40.89,21.14 34.8,21.14 ; 40.89,21.14 40.89,19.56 41.34,19.11 R3.1 ; 40.89,21.14 43.74,21.14
$2N121: length 2.2
  Top Layer w0.254: U3.19 33.26,1.9 R6.1
$2N232: length 2.7
  Top Layer w0.254: USB3.A5 46.22,6.37
$2N233: length 2.8
  Top Layer w0.254: R7.2 46.23,9.37 USB3.B5

## Copper pours and planes (outline as drawn; the poured copper is in the pictures)
GND on Top Layer: -6.22,53.72 61.09,53.72 61.09,-1.02 -6.22,-1.02
GND on Bottom Layer: -3.68,56.01 59.69,56.01 59.69,-3.94 -3.68,-3.94

Small or netless copper shapes (teardrops, artwork), in the pictures only: 201 on Top Layer, 40 on Bottom Layer
